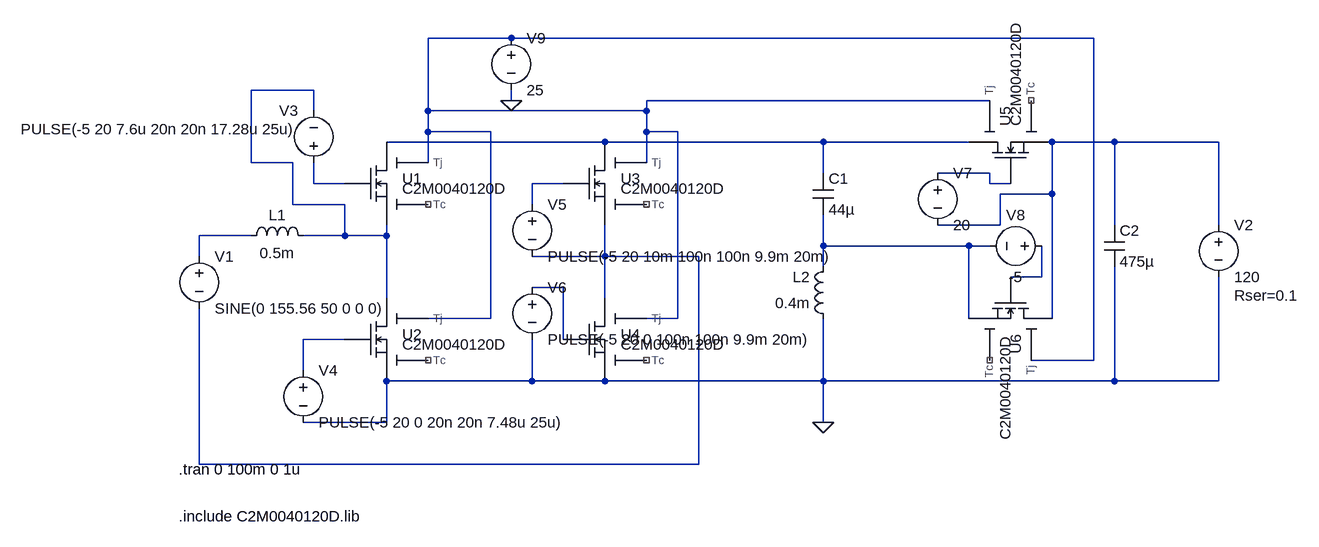
[diagram p0: schematic projectendetret (1).asc]
projectendetret (1).asc, the LTspice schematic file:
Version 4.1
SHEET 1 1624 680
WIRE 400 -144 272 -144
WIRE 1296 -144 400 -144
WIRE 96 -64 0 -64
WIRE 400 -48 400 -64
WIRE 1136 -48 608 -48
WIRE 96 -32 96 -64
WIRE 272 -32 272 -144
WIRE 608 -32 608 -48
WIRE 608 -32 272 -32
WIRE 272 0 272 -32
WIRE 368 0 272 0
WIRE 608 0 608 -32
WIRE 656 0 608 0
WIRE 544 16 208 16
WIRE 880 16 544 16
WIRE 1104 16 880 16
WIRE 1328 16 1232 16
WIRE 1488 16 1328 16
WIRE 0 48 0 -64
WIRE 64 48 0 48
WIRE 272 48 272 0
WIRE 608 48 608 0
WIRE 880 64 880 16
WIRE 1136 64 1056 64
WIRE 96 80 96 48
WIRE 144 80 96 80
WIRE 480 80 432 80
WIRE 1136 80 1136 64
WIRE 1168 80 1136 80
WIRE 1232 96 1232 16
WIRE 1232 96 1152 96
WIRE 64 112 64 48
WIRE 144 112 64 112
WIRE 432 112 432 80
WIRE 1152 144 1152 96
WIRE 1152 144 1056 144
WIRE 1328 144 1328 16
WIRE 1488 144 1488 16
WIRE 0 160 -80 160
WIRE 144 160 144 112
WIRE 144 160 80 160
WIRE 208 160 208 144
WIRE 208 160 144 160
WIRE 880 176 880 128
WIRE 1104 176 880 176
WIRE 1136 176 1104 176
WIRE -80 192 -80 160
WIRE 544 192 544 144
WIRE 544 192 432 192
WIRE 688 192 544 192
WIRE 880 208 880 176
WIRE 1216 224 1216 176
WIRE 1216 224 1168 224
WIRE 480 240 432 240
WIRE 208 256 208 160
WIRE 544 256 544 192
WIRE 368 288 368 0
WIRE 368 288 272 288
WIRE 656 288 656 0
WIRE 656 288 608 288
WIRE 1104 288 1104 176
WIRE 1232 288 1232 96
WIRE 144 320 80 320
WIRE 480 320 480 240
WIRE 1296 352 1296 -144
WIRE 1296 352 1200 352
WIRE 80 368 80 320
WIRE 432 384 432 320
WIRE 432 384 208 384
WIRE 544 384 432 384
WIRE 880 384 880 288
WIRE 880 384 544 384
WIRE 1328 384 1328 208
WIRE 1328 384 880 384
WIRE 1488 384 1488 224
WIRE 1488 384 1328 384
WIRE 208 448 208 384
WIRE 208 448 80 448
WIRE 880 448 880 384
WIRE -80 512 -80 272
WIRE 688 512 688 192
WIRE 688 512 -80 512
FLAG 880 448 0
FLAG 400 -48 0
SYMBOL C2M0040120D_latest 208 80 R0
SYMATTR InstName U1
SYMATTR SpiceModel ""
SYMBOL C2M0040120D_latest 208 320 R0
SYMATTR InstName U2
SYMATTR SpiceModel ""
SYMBOL C2M0040120D_latest 544 80 R0
SYMATTR InstName U3
SYMATTR SpiceModel ""
SYMBOL C2M0040120D_latest 544 320 R0
SYMATTR InstName U4
SYMATTR SpiceModel ""
SYMBOL ind -16 176 R270
WINDOW 0 32 56 VTop 2
WINDOW 3 5 56 VBottom 2
SYMATTR InstName L1
SYMATTR Value 0.5m
SYMBOL voltage -80 176 R0
WINDOW 123 0 0 Left 0
WINDOW 39 0 0 Left 0
SYMATTR InstName V1
SYMATTR Value SINE(0 155.56 50 0 0 0)
SYMBOL cap 864 64 R0
SYMATTR InstName C1
SYMATTR Value 44µ
SYMBOL ind 896 304 R180
WINDOW 0 36 80 Left 2
WINDOW 3 36 40 Left 2
SYMATTR InstName L2
SYMATTR Value 0.4m
SYMBOL C2M0040120D_latest 1168 16 R270
SYMATTR InstName U5
SYMATTR SpiceModel ""
SYMBOL C2M0040120D_latest 1168 288 R90
SYMATTR InstName U6
SYMATTR SpiceModel ""
SYMBOL cap 1312 144 R0
SYMATTR InstName C2
SYMATTR Value 475µ
SYMBOL voltage 1488 128 R0
WINDOW 123 0 0 Left 0
WINDOW 39 24 124 Left 2
SYMATTR SpiceLine Rser=0.1
SYMATTR InstName V2
SYMATTR Value 120
SYMBOL voltage 80 352 R0
WINDOW 123 0 0 Left 0
WINDOW 39 0 0 Left 0
SYMATTR InstName V4
SYMATTR Value PULSE(-5 20 0 20n 20n 7.48u 25u)
SYMBOL voltage 432 96 R0
WINDOW 123 0 0 Left 0
WINDOW 39 0 0 Left 0
SYMATTR InstName V5
SYMATTR Value PULSE(-5 20 10m 100n 100n 9.9m 20m)
SYMBOL voltage 432 224 R0
WINDOW 123 0 0 Left 0
WINDOW 39 0 0 Left 0
SYMATTR InstName V6
SYMATTR Value PULSE(-5 20 0 100n 100n 9.9m 20m)
SYMBOL voltage 1056 48 R0
WINDOW 123 0 0 Left 0
WINDOW 39 0 0 Left 0
SYMATTR InstName V7
SYMATTR Value 20
SYMBOL voltage 96 64 R180
WINDOW 0 24 96 Left 2
WINDOW 3 24 68 Left 2
WINDOW 123 0 0 Left 0
WINDOW 39 0 0 Left 0
SYMATTR InstName V3
SYMATTR Value PULSE(-5 20 7.6u 20n 20n 17.28u 25u)
SYMBOL voltage 1232 176 R90
WINDOW 0 -32 56 VBottom 2
WINDOW 3 32 56 VTop 2
WINDOW 123 0 0 Left 0
WINDOW 39 0 0 Left 0
SYMATTR InstName V8
SYMATTR Value -5
SYMBOL voltage 400 -160 R0
WINDOW 123 0 0 Left 0
WINDOW 39 0 0 Left 0
SYMATTR InstName V9
SYMATTR Value 25
TEXT -112 520 Left 2 !.tran 0 100m 0 1u
TEXT -112 592 Left 2 !.include C2M0040120D.lib

The netlist it stands for:
* projectendetret (1).asc
X§U1 N003 N006 N002 N001 NC_01 C2M0040120D  ; pins d g s Tj Tc
X§U2 N002 N013 0 N001 NC_02 C2M0040120D  ; pins d g s Tj Tc
X§U3 N003 N007 N010 N001 NC_03 C2M0040120D  ; pins d g s Tj Tc
X§U4 N010 N012 0 N001 NC_04 C2M0040120D  ; pins d g s Tj Tc
L1 N008 N002 0.5m
V1 N008 N010 SINE(0 155.56 50 0 0 0)
C1 N003 N009 44µ
L2 0 N009 0.4m
X§U5 N003 N005 N004 N001 NC_05 C2M0040120D  ; pins d g s Tj Tc
X§U6 N004 N011 N009 N001 NC_06 C2M0040120D  ; pins d g s Tj Tc
C2 N004 0 475µ
V2 N004 0 120 Rser=0.1
V4 N013 0 PULSE(-5 20 0 20n 20n 7.48u 25u)
V5 N007 N010 PULSE(-5 20 10m 100n 100n 9.9m 20m)
V6 N012 0 PULSE(-5 20 0 100n 100n 9.9m 20m)
V7 N005 N004 20
V3 N006 N002 PULSE(-5 20 7.6u 20n 20n 17.28u 25u)
V8 N011 N009 -5
V9 N001 0 25
.tran 0 100m 0 1u
.include C2M0040120D.lib
.backanno
.end